# EAGLE design LSM9DS1-breakout (EAGLE 9.6.1)
REVISION: 1.0; SCH_DESC: Breakout board for the LSM9DS1; TEAM: RoboCup
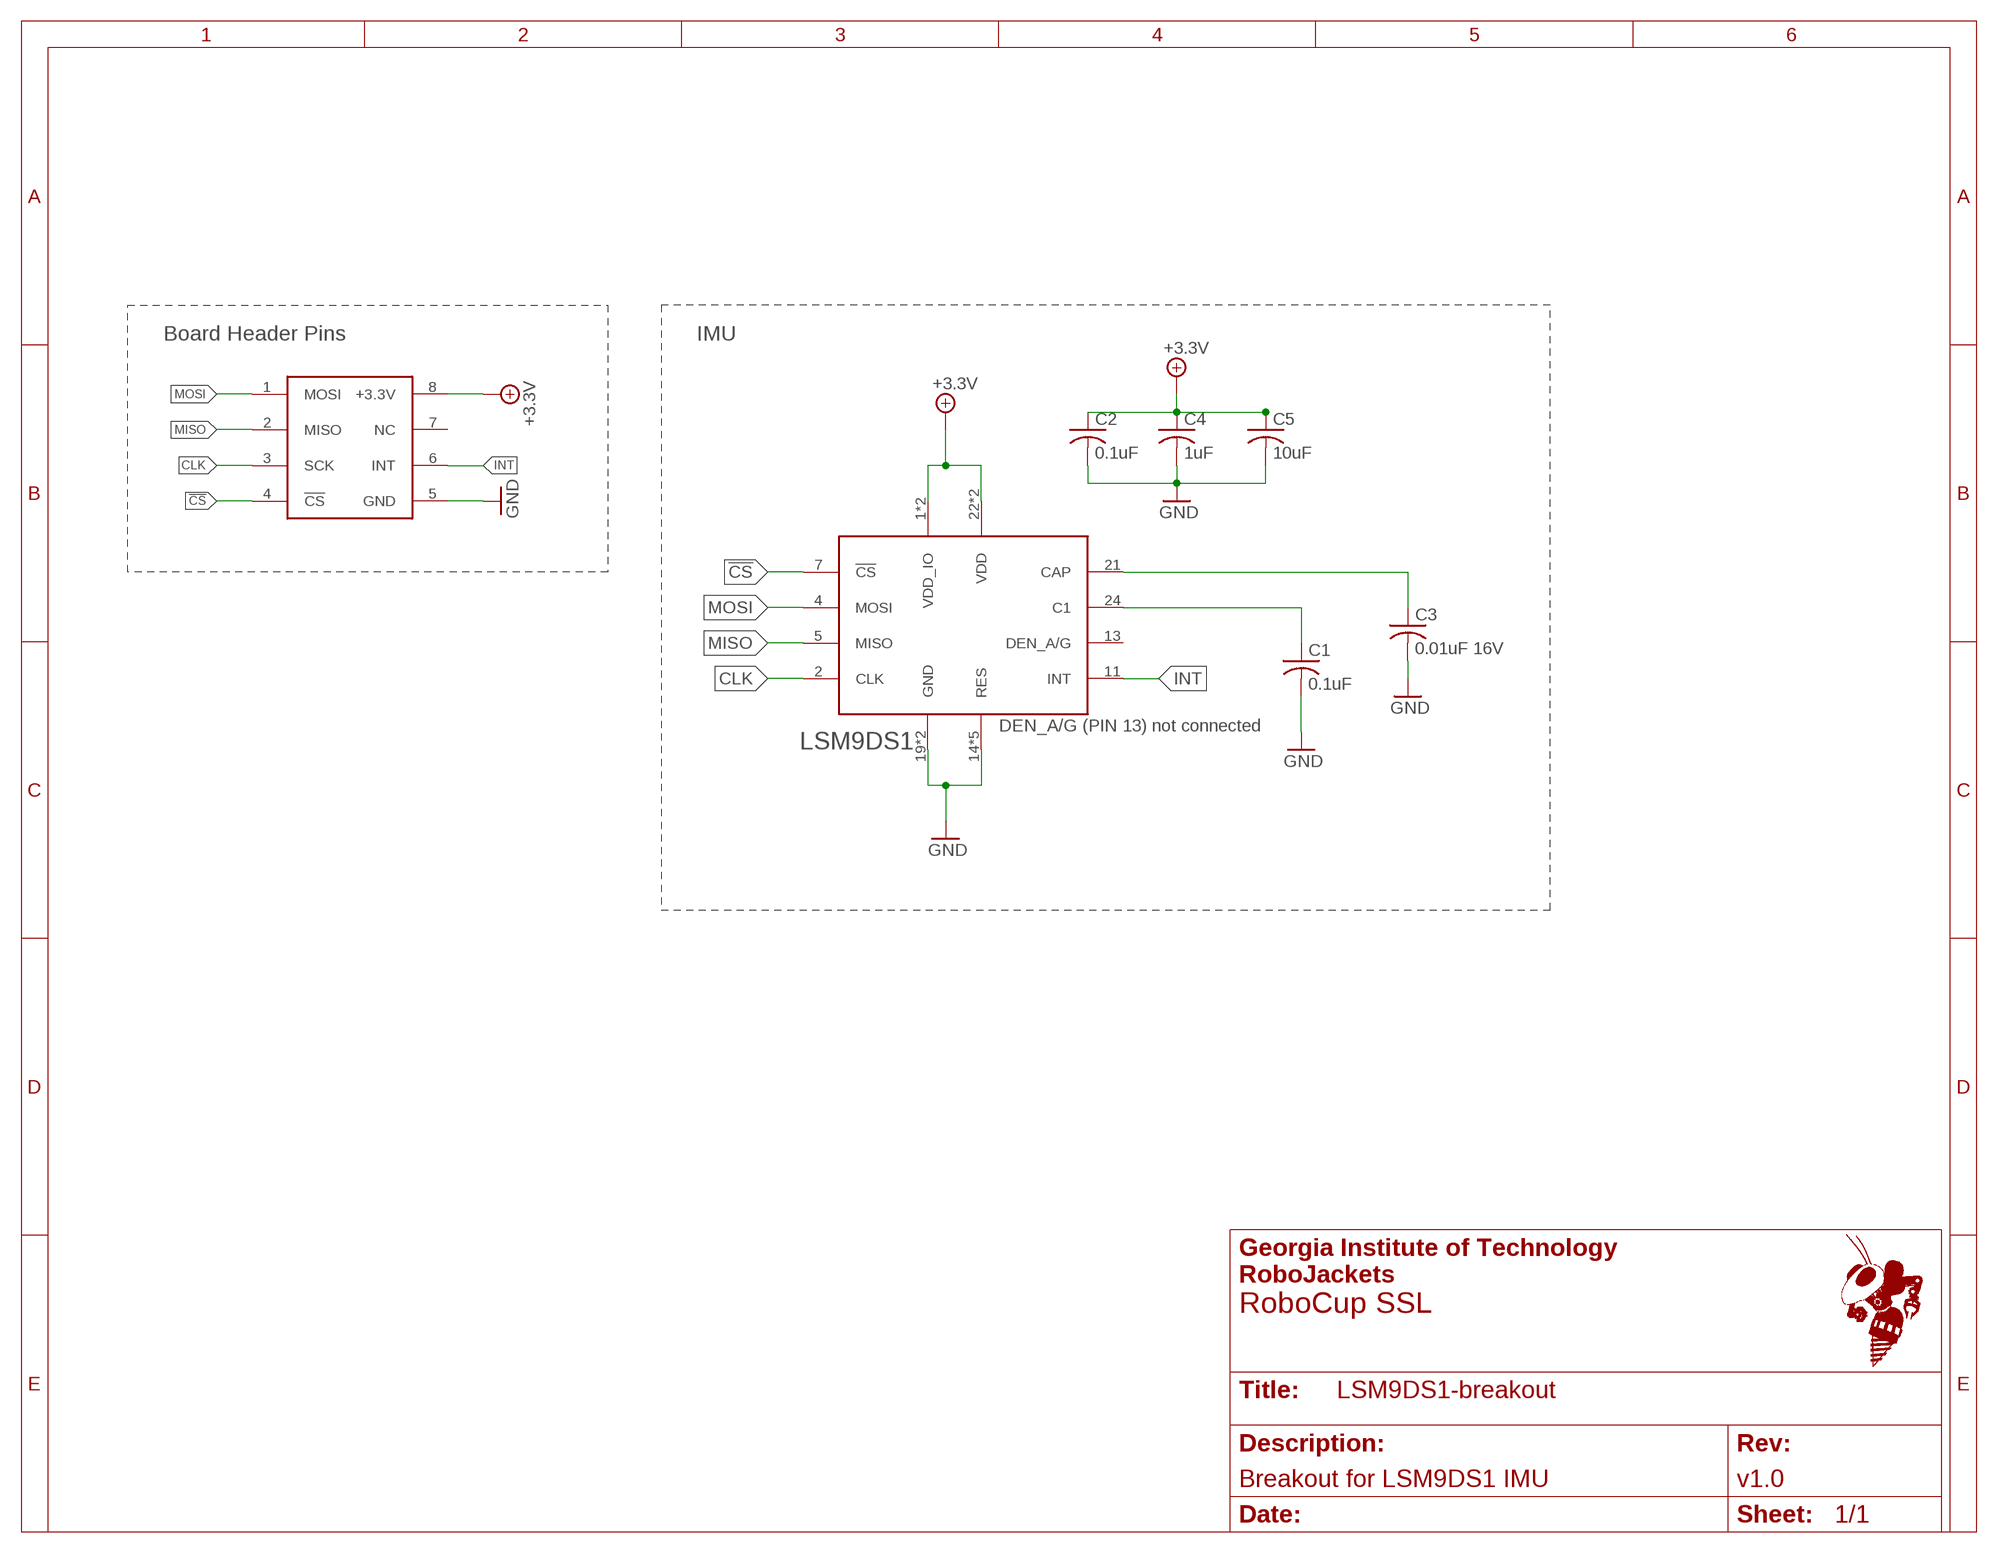
[diagram p0: schematic, sheet 1]
FRAME1 (FRAME_A_L): REVISION: v1.0; SCH_DESC: Breakout for LSM9DS1 IMU; TEAM: RoboCup SSL

## Parts
C1  0.1uF  C-USC0603  [C0603]
C2  0.1uF  C-USC0603  [C0603]
C3  0.01uF 16V  C-USC0603  [C0603]
C4  1uF  C-USC0603  [C0603]
C5  10uF  C-USC0603  [C0603]
KIT1  IMUIMU-KIT  [IMU-KIT]
U1  LSM9DS1  [LGA-24L]

## Nets
!CS!: KIT1.4(!CS!) U1.7(!CS!)
+3.3V: C2.1 C4.1 C5.1 KIT1.8(+3.3V) U1.1(VDD_IO) U1.3(VDD_IO) U1.22(VDD) U1.23(VDD)
C1: C1.1 U1.24(C1)
CAP: C3.1 U1.21(CAP)
CLK: KIT1.3(SCK) U1.2(CLK)
GND: C1.2 C2.2 C3.2 C4.2 C5.2 KIT1.5(GND) U1.14(RES) U1.15(RES) U1.16(RES) U1.17(RES) U1.18(RES) U1.19(GND) U1.20(GND)
INT: KIT1.6(INT) U1.11(INT)
MISO: KIT1.2(MISO) U1.5(MISO)
MOSI: KIT1.1(MOSI) U1.4(MOSI)
Unconnected: KIT1.7(NC) U1.13(DEN_A/G)

## Notes on the sheet
- Board Header Pins | IMU
- DEN_A/G (PIN 13) not connected

## Library data of the parts
C1-C5 = rcl:C-US: CAPACITOR, American symbol; SPICEPREFIX: C
KIT1 = RoboJackets-Boards:IMU: IMU breakout board
U1 = RoboJackets-Sensors:LSM9DS1

## Board
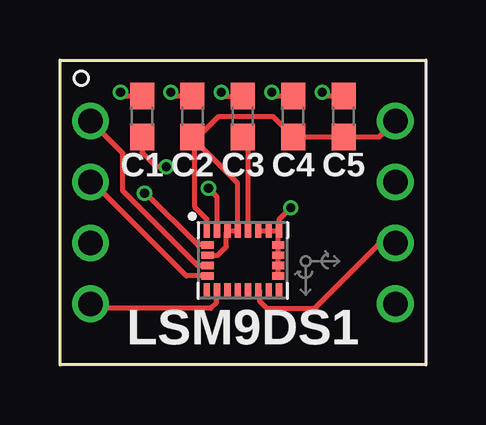
[diagram p1: board, top side]
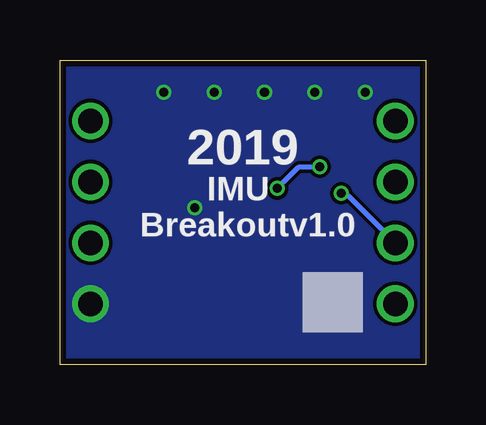
[diagram p2: board, bottom side, seen from below]

Size 15.24 x 12.7 mm. Coordinates in mm from the lower left corner, seen from the top.
Outline: 0,0 15.24,0 15.24,12.7 0,12.7 0,0
Copper layers (1*16): Top 0.018mm / dielectric 1.55mm / Bottom 0.018mm
Design rules "eC_2Layer_PClass6_BaseCopperO18_eCDefault": minimum track width 0.15mm, minimum drill 0.35mm, track to track 0.15mm, track to pad 0.15mm, pad to pad 0.15mm, via to via 0.15mm, smd to smd 0mil, copper to edge 0.25mm, drill to drill 0.35mm, minimum pad ring 0.175mm, minimum via ring 0.125mm, stop-mask expansion 0mil, vias tented up to drill 0.45mm, thermal gap 0.2mm

### Footprints (pad centres in the part's own frame; a part is rotated, then mirrored left to right if it is on the bottom)
C0603 = smd 1.1 x 1: 1 -0.85,0; 2 0.85,0
IMU-KIT = drill 1.02: 1 -6.35,3.81; 2 -6.35,1.27; 3 -6.35,-1.27; 4 -6.35,-3.81; 5 6.35,-3.81; 6 6.35,-1.27; 7 6.35,1.27; 8 6.35,3.81
LGA-24L = smd 0.28 x 0.53: 1 -1.505,1.22; 6 -1.505,-1.22; 7 -1.075,-1.22; 8 -0.645,-1.22; 9 -0.215,-1.22; 10 0.215,-1.22; 11 0.645,-1.22; 12 1.075,-1.22; 13 1.505,-1.22; 18 1.505,1.22; 19 1.075,1.22; 20 0.645,1.22; 21 0.215,1.22; 22 -0.215,1.22; 23 -0.645,1.22; 24 -1.075,1.22 | smd 0.53 x 0.28: 2 -1.47,0.645; 3 -1.47,0.215; 4 -1.47,-0.215; 5 -1.47,-0.645; 14 1.47,-0.645; 15 1.47,-0.215; 16 1.47,0.215; 17 1.47,0.645

### Placement (x,y rotation side)
C1  3.42,10.35 90 top
C2  5.52,10.35 90 top
C3  7.62,10.35 90 top
C4  9.72,10.35 90 top
C5  11.82,10.35 90 top
KIT1  7.62,6.35 0 top
U1  7.62,4.35 0 top

### Tracks (layer width: path | path; a pad name or v marks a point on that pad's centre or on a via)
!CS!
  Top 0.2: U1.7 6.5,3.09 6.5,2.57 6.29,2.35 1.46,2.35 KIT1.4
+3.3V
  Top 0.2: U1.1 6.12,6.07 5.62,6.56 5.62,9.35 | 5.62,9.35 5.62,9.4 C2.1 5.77,9.5 6.62,10.35 8.87,10.35 C4.1 C5.1 13.31,9.5 KIT1.8 | 5.62,9.35 7.41,7.56 U1.22 U1.23 6.94,5.53 6.94,4.93 6.57,4.56 U1.3
C1  (via drill 0.38)
  Top 0.2: U1.24 6.54,6.99 v6.19,7.35 | v4.42,8.25 4.02,8.25 3.42,8.85 C1.1
  Bottom 0.2: v6.19,7.35 5.29,8.25 v4.42,8.25
CAP
  Top 0.2: U1.21 7.83,9.29 C3.1
CLK  (via drill 0.38)
  Top 0.2: U1.2 5.74,4.99 3.58,7.15 v3.52,7.15
  Bottom 0.2: v3.52,7.15 3.34,7.15 KIT1.3
GND  (via drill 0.38)
  Top 0.2: U1.14 U1.15 U1.16 U1.17 9.09,5.54 U1.18 | U1.18 U1.19 U1.20 | U1.18 9.12,6.05 v9.62,6.55 | C2.2 4.77,11.2 v4.62,11.35 | 9.57,11.35 C4.2 8.97,11.2 v8.82,11.35 | 11.67,11.35 C5.2 11.07,11.2 v10.92,11.35 | v6.72,11.35 6.87,11.2 C3.2 | C1.2 2.67,11.2 v2.52,11.35
  pour Bottom (no thermals): 0,12.7 15.24,12.7 15.24,0 0,0
INT
  Top 0.2: U1.11 8.3,3.09 8.3,2.67 8.62,2.35 10.62,2.35 13.35,5.08 KIT1.6
MISO
  Top 0.2: U1.5 5.27,3.7 1.35,7.62 KIT1.2
MOSI
  Top 0.2: U1.4 5.74,4.13 2.62,7.25 2.62,8.81 KIT1.1

### Text on the board
tPlace: LSM9DS1
bPlace: 2019 | IMU / Breakout